# Altium schematic sheet Interface.SchDoc
size 228 x 177 mm; SheetNumber: 4; SheetTotal: 5
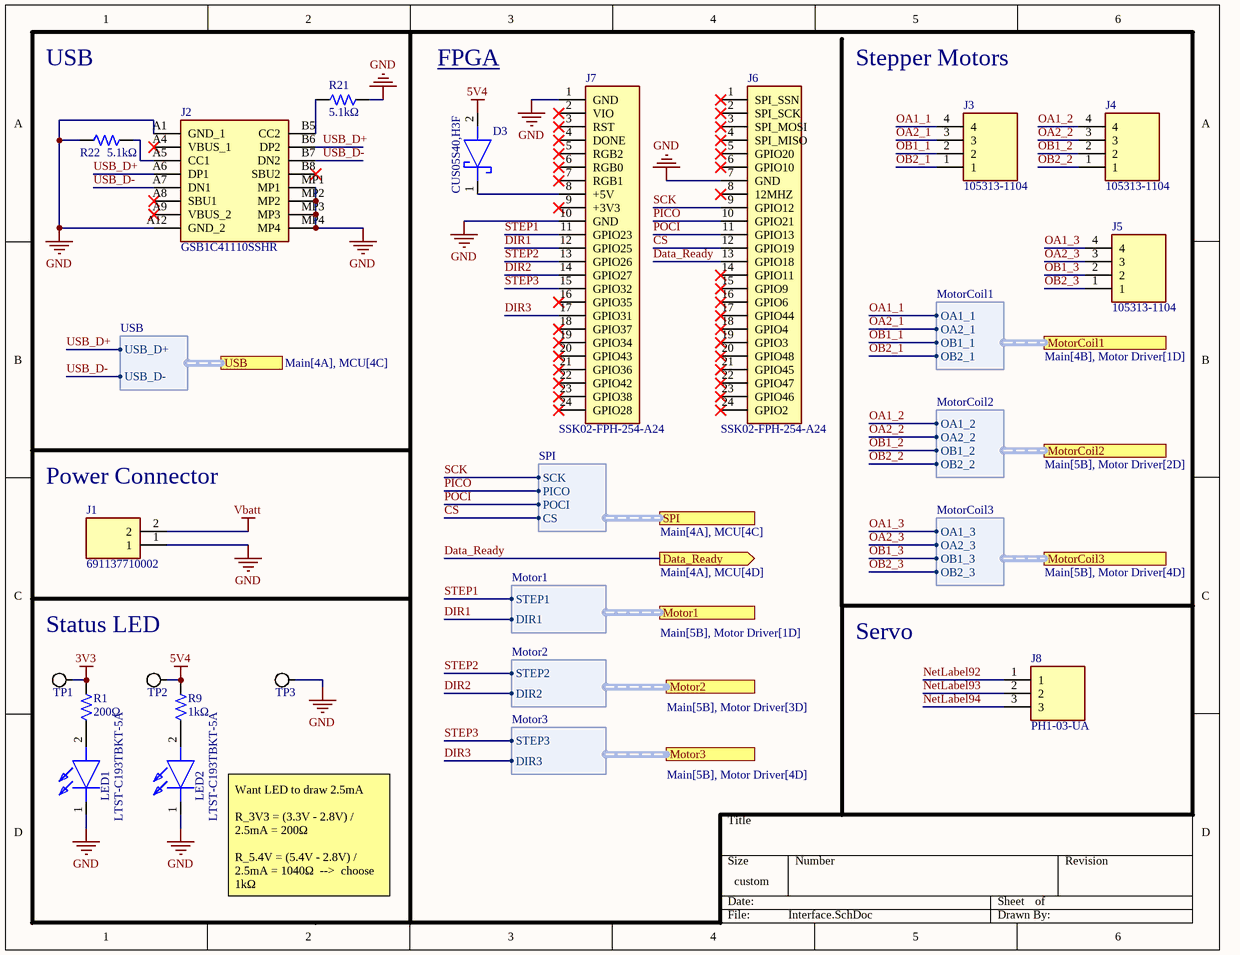
[diagram p0: Interface.SchDoc]

## Parts
D3  CUS05S40,H3F  [CUZ10V]
J1  691137710002  [SHDR2W70P0X500_1X2_1000X750X1150P]
J2  GSB1C41110SSHR  [GSB1C41110SSHR]
J3  105313-1104  [1053131104]
J4  105313-1104  [1053131104]
J5  105313-1104  [1053131104]
J6  SSK02-FPH-254-A24  [RHDR24W69P0X254_1X24_6146X250X870P]
J7  SSK02-FPH-254-A24  [RHDR24W69P0X254_1X24_6146X250X870P]
J8  PH1-03-UA  [HDRV3W64P0X254_1X3_762X250X952P]
LED1  LTST-C193TBKT-5A  [LEDC1608X45N]
LED2  LTST-C193TBKT-5A  [LEDC1608X45N]
R1  Resistance: 200Ω  [RES-0603]  (hidden comment: 0603WAF2000T5E)
R9  Resistance: 1kΩ  [RES-0603]  (hidden comment: 0603WAF1001T5E)
R21  Resistance: 5.1kΩ  [RES-0603]  (hidden comment: 0603WAF5101T5E)
R22  Resistance: 5.1kΩ  [RES-0603]  (hidden comment: 0603WAF5101T5E)
TP1  Test Point Loop  [Test Point Loop - Black]  (value not drawn)
TP2  Test Point Loop  [Test Point Loop - Black]  (value not drawn)
TP3  Test Point Loop  [Test Point Loop - Black]  (value not drawn)

## Ports
Data_Ready (out, see Main[4A], MCU[4D]), Motor1 (harness Motor1, see Main[5B], Motor Driver[1D]), Motor2 (harness Motor2, see Main[5B], Motor Driver[3D]), Motor3 (harness Motor3, see Main[5B], Motor Driver[4D]), MotorCoil1 (harness MotorCoil1, see Main[4B], Motor Driver[1D]), MotorCoil2 (harness MotorCoil2, see Main[5B], Motor Driver[2D]), MotorCoil3 (harness MotorCoil3, see Main[5B], Motor Driver[4D]), SPI (harness SPI, see Main[4A], MCU[4C]), USB (harness USB, see Main[4A], MCU[4C])

## Harnesses
SPI: SCK, PICO, POCI, CS
MotorCoil1: OA1_1, OA2_1, OB1_1, OB2_1
MotorCoil2: OA1_2, OA2_2, OB1_2, OB2_2
MotorCoil3: OA1_3, OA2_3, OB1_3, OB2_3
Motor1: STEP1, DIR1
Motor2: STEP2, DIR2
Motor3: STEP3, DIR3
USB: USB_D+, USB_D-

## Nets
3V3: R1.2 TP1.1
5V4: D3.2(A) R9.2 TP2.1
GND: J1.1 J2.A1(GND_1) J2.A12(GND_2) J2.MP1 J2.MP2 J2.MP3 J2.MP4 J6.7(GND) J7.1(GND) J7.10(GND) LED1.1(K) LED2.1(K) R21.2 R22.1 TP3.1
Vbatt: J1.2
CS: J6.12(GPIO19) ; port SPI.CS
Data_Ready: J6.13(GPIO18) ; port Data_Ready
DIR1: J7.12(GPIO25) ; port Motor1.DIR1
DIR2: J7.14(GPIO27) ; port Motor2.DIR2
DIR3: J7.17(GPIO31) ; port Motor3.DIR3
NetLabel92: J8.1
NetLabel93: J8.2
NetLabel94: J8.3
OA1_1: J3.4 ; port MotorCoil1.OA1_1
OA1_2: J4.4 ; port MotorCoil2.OA1_2
OA1_3: J5.4 ; port MotorCoil3.OA1_3
OA2_1: J3.3 ; port MotorCoil1.OA2_1
OA2_2: J4.3 ; port MotorCoil2.OA2_2
OA2_3: J5.3 ; port MotorCoil3.OA2_3
OB1_1: J3.2 ; port MotorCoil1.OB1_1
OB1_2: J4.2 ; port MotorCoil2.OB1_2
OB1_3: J5.2 ; port MotorCoil3.OB1_3
OB2_1: J3.1 ; port MotorCoil1.OB2_1
OB2_2: J4.1 ; port MotorCoil2.OB2_2
OB2_3: J5.1 ; port MotorCoil3.OB2_3
PICO: J6.10(GPIO21) ; port SPI.PICO
POCI: J6.11(GPIO13) ; port SPI.POCI
SCK: J6.9(GPIO12) ; port SPI.SCK
STEP1: J7.11(GPIO23) ; port Motor1.STEP1
STEP2: J7.13(GPIO26) ; port Motor2.STEP2
STEP3: J7.15(GPIO32) ; port Motor3.STEP3
USB_D+: J2.A6(DP1) J2.B6(DP2) ; port USB.USB_D+
USB_D-: J2.A7(DN1) J2.B7(DN2) ; port USB.USB_D-
NetD3_1: D3.1(K) J7.8(+5V)
NetJ2_A5: J2.A5(CC1) R22.2
NetJ2_B5: J2.B5(CC2) R21.1
NetLED1_2: LED1.2(A) R1.1
NetLED2_2: LED2.2(A) R9.1

Not connected (* = marked no-connect by the designer): J2 A4(VBUS_1)* A8(SBU1)* A9(VBUS_2)* B8(SBU2)*; J6 1(SPI_SSN)* 2(SPI_SCK)* 3(SPI_MOSI)* 4(SPI_MISO)* 5(GPIO20)* 6(GPIO10)* 8(12MHZ)* 14(GPIO11)* 15(GPIO9)* 16(GPIO6)* 17(GPIO44)* 18(GPIO4)* 19(GPIO3)* 20(GPIO48)* 21(GPIO45)* 22(GPIO47)* 23(GPIO46)* 24(GPIO2)*; J7 2(VIO)* 3(RST)* 4(DONE)* 5(RGB2)* 6(RGB0)* 7(RGB1)* 9(+3V3)* 16(GPIO35)* 18(GPIO37)* 19(GPIO34)* 20(GPIO43)* 21(GPIO36)* 22(GPIO42)* 23(GPIO38)* 24(GPIO28)*

## Notes on the sheet
- USB
- FPGA <https://upduino.readthedocs.io/en/latest/introduction/introduction.html>
- Stepper Motors
- (near J1) Power Connector
- Status LED
- Servo
- Want LED to draw 2.5mA
  R_3V3 = (3.3V - 2.8V) / 2.5mA = 200Ω
  R_5.4V = (5.4V - 2.8V) / 2.5mA = 1040Ω  -->  choose 1kΩ

## Library data of the parts
D3 = CUS05S40,H3F: CUS05S40,H3F, Schottky Diode; Manufacturer_Name: Toshiba; Datasheet Link: http://toshiba.semicon-storage.com/info/docget.jsp?did=14743&prodName=CUS05S40; Height: 1.1mm; Manufacturer_Part_Number: CUS05S40,H3F; Mouser Part Number: 757-CUS05S40H3F; Mouser Price/Stock: https://www.mouser.co.uk/ProductDetail/Toshiba/CUS05S40H3F?qs=cW4DzVrAanNdPcmUvyvUwQ%3D%3D; Arrow Part Number: CUS05S40,H3F; Arrow Price/Stock: https://www.arrow.com/en/products/cus05s40h3f/toshiba?utm_currency=USD&region=nac
J1 = 691137710002: Connector; Manufacturer_Name: Wurth Elektronik; Datasheet Link: https://www.we-online.com/catalog/datasheet/691137710002.pdf; Height: 11.5mm; Manufacturer_Part_Number: 691137710002; Mouser Part Number: 710-691137710002; Mouser Price/Stock: https://www.mouser.co.uk/ProductDetail/Wurth-Elektronik/691137710002?qs=lBTPRtX1sU9LnHBbviNKGA%3D%3D
J2 = GSB1C41110SSHR: Connector; Manufacturer_Name: Amphenol Communications Solutions; Datasheet Link: https://cdn.amphenol-cs.com/media/wysiwyg/files/drawing/gsb1c41x10sshr-ax1.pdf; Height: 3.41mm; Manufacturer_Part_Number: GSB1C41110SSHR; Arrow Part Number: GSB1C41110SSHR; Arrow Price/Stock: https://www.arrow.com/en/products/gsb1c41110sshr/amphenol-fci.html?utm_currency=USD&region=asia
J3-J5 = 105313-1104: 4-Pin Right Angle Nanofit; Manufacturer_Name: Molex; Datasheet Link: http://www.molex.com/webdocs/datasheets/pdf/en-us//1053131104_PCB_HEADERS.pdf; Height: 6.84mm; Manufacturer_Part_Number: 105313-1104; Mouser Part Number: 538-105313-1104; Mouser Price/Stock: https://www.mouser.co.uk/ProductDetail/Molex/105313-1104?qs=PqFvFmEiOr4uJzhImSsntA%3D%3D
J6 J7 = SSK02-FPH-254-A24: Connector; Manufacturer_Name: Same Sky; Datasheet Link: https://www.sameskydevices.com/product/resource/ssk02-fph-254.pdf; Height: 8.7mm; Manufacturer_Part_Number: SSK02-FPH-254-A24
J8 = PH1-03-UA: Connector; Manufacturer_Name: Adam Tech; Datasheet Link: https://datasheet.datasheetarchive.com/originals/distributors/Datasheets_SAMA/34c52fbb4019bb4b288b881302863af3.pdf; Height: 9.516mm; Manufacturer_Part_Number: PH1-03-UA; Mouser Part Number: 737-PH1-03-UA; Mouser Price/Stock: https://www.mouser.co.uk/ProductDetail/Adam-Tech/PH1-03-UA?qs=HoCaDK9Nz5cktq3WKneQTQ%3D%3D; Arrow Part Number: PH1-03-UA; Arrow Price/Stock: https://www.arrow.com/en/products/ph1-03-ua/adam-tech?utm_currency=USD&region=europe
R1 = 0603WAF2000T5E: Resistor, 200Ω, ±1%, 100mW, 75V, ±100ppm/℃, -55℃~+155℃, SMD 0603; Manufacturer: Uniroyal; Supplier 1: LCSC; Manufacturer Part Number: 0603WAF2000T5E; Supplier Part Number 1: C8218; JLCPCB Part Number: C8218; Power Rating: 100mW; Category: Resistors; Package Size: 0603; JLCPCB Basic Part: Yes; Tolerance: ±1%; Voltage Rating: 75V; Temperature Coefficient: ±100ppm/℃; Temperature Rating: -55℃~+155℃; ComponentLink1Description: Datasheet; ComponentLink1URL: https://wmsc.lcsc.com/wmsc/upload/file/pdf/v2/lcsc/2206010216_UNI-ROYAL-Uniroyal-Elec-0603WAF2000T5E_C8218.pdf; ComponentLink2Description: JLCPCB Part URL; ComponentLink2URL: https://jlcpcb.com/partdetail/C8218
R9 = 0603WAF1001T5E: Resistor, 1kΩ, ±1%, 100mW, 75V, ±100ppm/℃, -55℃~+155℃, SMD 0603; Manufacturer: Uniroyal; Supplier 1: LCSC; Manufacturer Part Number: 0603WAF1001T5E; Supplier Part Number 1: C21190; JLCPCB Part Number: C21190; Power Rating: 100mW; Category: Resistors; Package Size: 0603; JLCPCB Basic Part: Yes; Tolerance: ±1%; Voltage Rating: 75V; Temperature Coefficient: ±100ppm/℃; Temperature Rating: -55℃~+155℃; ComponentLink1Description: Datasheet; ComponentLink1URL: https://wmsc.lcsc.com/wmsc/upload/file/pdf/v2/lcsc/2206010130_UNI-ROYAL-Uniroyal-Elec-0603WAF1001T5E_C21190.pdf; ComponentLink2Description: JLCPCB Part URL; ComponentLink2URL: https://jlcpcb.com/partdetail/C21190
R21 R22 = 0603WAF5101T5E: Resistor, 5.1kΩ, ±1%, 100mW, 75V, ±100ppm/℃, -55℃~+155℃, SMD 0603; Manufacturer: Uniroyal; Supplier 1: LCSC; Manufacturer Part Number: 0603WAF5101T5E; Supplier Part Number 1: C23186; JLCPCB Part Number: C23186; Power Rating: 100mW; Category: Resistors; Package Size: 0603; JLCPCB Basic Part: Yes; Tolerance: ±1%; Voltage Rating: 75V; Temperature Coefficient: ±100ppm/℃; Temperature Rating: -55℃~+155℃; ComponentLink1Description: Datasheet; ComponentLink1URL: https://wmsc.lcsc.com/wmsc/upload/file/pdf/v2/lcsc/2206010116_UNI-ROYAL-Uniroyal-Elec-0603WAF5101T5E_C23186.pdf; ComponentLink2Description: JLCPCB Part URL; ComponentLink2URL: https://jlcpcb.com/partdetail/C23186
TP1-TP3 = Test Point Loop: Keyston Electronics 5001 Test Point Loop; Manufacturer P/N: 5001; Manufacturer: Keystone Electronics; Color: Black; Supplier 1: Digi-Key; Supplier Part Number 1: 36-5001-ND